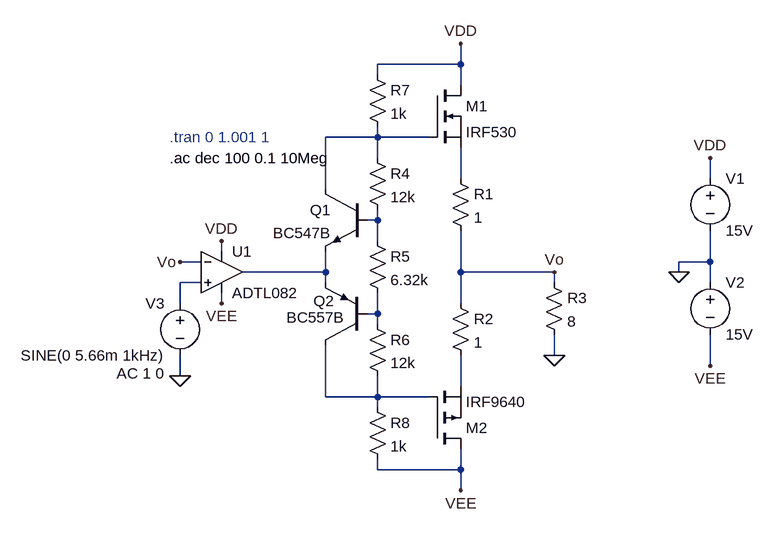
[diagram p0: schematic ClaseB_Completo_MOSFET.asc]
ClaseB_Completo_MOSFET.asc, the LTspice schematic file:
Version 4.1
SHEET 1 880 728
WIRE 320 -16 320 -48
WIRE 320 -16 192 -16
WIRE 192 0 192 -16
WIRE 320 16 320 -16
WIRE 192 96 192 80
WIRE 192 96 112 96
WIRE 272 96 192 96
WIRE 192 128 192 96
WIRE 320 160 320 112
WIRE 704 160 704 128
WIRE 112 176 112 96
WIRE 192 224 192 208
WIRE 192 224 176 224
WIRE 192 256 192 224
WIRE -48 272 -48 256
WIRE -80 288 -112 288
WIRE 704 288 704 240
WIRE 704 288 656 288
WIRE 112 304 112 272
WIRE 112 304 -16 304
WIRE 320 304 320 240
WIRE 464 304 320 304
WIRE 656 304 656 288
WIRE -80 320 -112 320
WIRE 112 320 112 304
WIRE 464 320 464 304
WIRE 704 320 704 288
WIRE -112 352 -112 320
WIRE -48 352 -48 336
WIRE 320 352 320 304
WIRE 192 368 192 336
WIRE 192 368 176 368
WIRE 192 384 192 368
WIRE 464 432 464 400
WIRE 704 448 704 400
WIRE -112 464 -112 432
WIRE 320 480 320 432
WIRE 112 496 112 416
WIRE 192 496 192 464
WIRE 192 496 112 496
WIRE 272 496 192 496
WIRE 192 512 192 496
WIRE 192 608 192 592
WIRE 320 608 320 576
WIRE 320 608 192 608
WIRE 320 640 320 608
FLAG 320 -48 VDD
FLAG 320 640 VEE
FLAG 464 432 0
FLAG 656 304 0
FLAG 704 128 VDD
FLAG 704 448 VEE
FLAG -48 256 VDD
FLAG -48 352 VEE
FLAG -112 464 0
FLAG 464 304 Vo
FLAG -112 288 Vo
SYMBOL nmos 272 16 R0
SYMATTR InstName M1
SYMATTR Value IRF530
SYMBOL pmos 272 576 M180
SYMATTR InstName M2
SYMATTR Value IRF9640
SYMBOL res 304 144 R0
SYMATTR InstName R1
SYMATTR Value 1
SYMBOL res 304 336 R0
SYMATTR InstName R2
SYMATTR Value 1
SYMBOL res 448 304 R0
SYMATTR InstName R3
SYMATTR Value 8
SYMBOL voltage 704 144 R0
WINDOW 123 0 0 Left 0
WINDOW 39 0 0 Left 0
SYMATTR InstName V1
SYMATTR Value 15V
SYMBOL voltage 704 304 R0
WINDOW 123 0 0 Left 0
WINDOW 39 0 0 Left 0
SYMATTR InstName V2
SYMATTR Value 15V
SYMBOL npn 176 176 M0
SYMATTR InstName Q1
SYMATTR Value BC547B
SYMBOL pnp 176 416 R180
WINDOW 0 50 68 Left 2
WINDOW 3 35 42 Left 2
SYMATTR InstName Q2
SYMATTR Value BC557B
SYMBOL res 176 112 R0
SYMATTR InstName R4
SYMATTR Value 12k
SYMBOL res 176 240 R0
SYMATTR InstName R5
SYMATTR Value 6.32k
SYMBOL res 176 368 R0
SYMATTR InstName R6
SYMATTR Value 12k
SYMBOL res 176 -16 R0
SYMATTR InstName R7
SYMATTR Value 1k
SYMBOL res 176 496 R0
SYMATTR InstName R8
SYMATTR Value 1k
SYMBOL OpAmps\\ADTL082 -48 240 R0
SYMATTR InstName U1
SYMBOL voltage -112 336 M0
WINDOW 123 24 124 Left 2
WINDOW 39 0 0 Left 0
SYMATTR Value2 AC 1 0
SYMATTR InstName V3
SYMATTR Value SINE(0 5.66m 1kHz)
TEXT -128 96 Left 2 ;.tran 0 1.001 1
TEXT -128 128 Left 2 !.ac dec 100 0.1 10Meg

The netlist it stands for:
* ClaseB_Completo_MOSFET.asc
M1 VDD N001 N002 N002 IRF530
M2 VEE N008 N007 N007 IRF9640
R1 N002 Vo 1
R2 Vo N007 1
R3 Vo 0 8
V1 VDD 0 15V
V2 0 VEE 15V
Q1 N001 N003 N004 0 BC547B
Q2 N008 N006 N004 0 BC557B
R4 N001 N003 12k
R5 N003 N006 6.32k
R6 N006 N008 12k
R7 VDD N001 1k
R8 N008 VEE 1k
X§U1 N005 Vo VDD VEE N004 ADTL082  ; pins In+ In- V+ V- OUT
V3 N005 0 SINE(0 5.66m 1kHz) AC 1 0
.model NPN NPN
.model PNP PNP
.lib standard.bjt
.model NMOS NMOS
.model PMOS PMOS
.lib standard.mos
* .tran 0 1.001 1
.ac dec 100 0.1 10Meg
.lib ADI.lib
.backanno
.end